# Altium schematic sheet Copy of LEDs.SchDoc
size A2; SheetNumber: 2; SheetTotal: 2
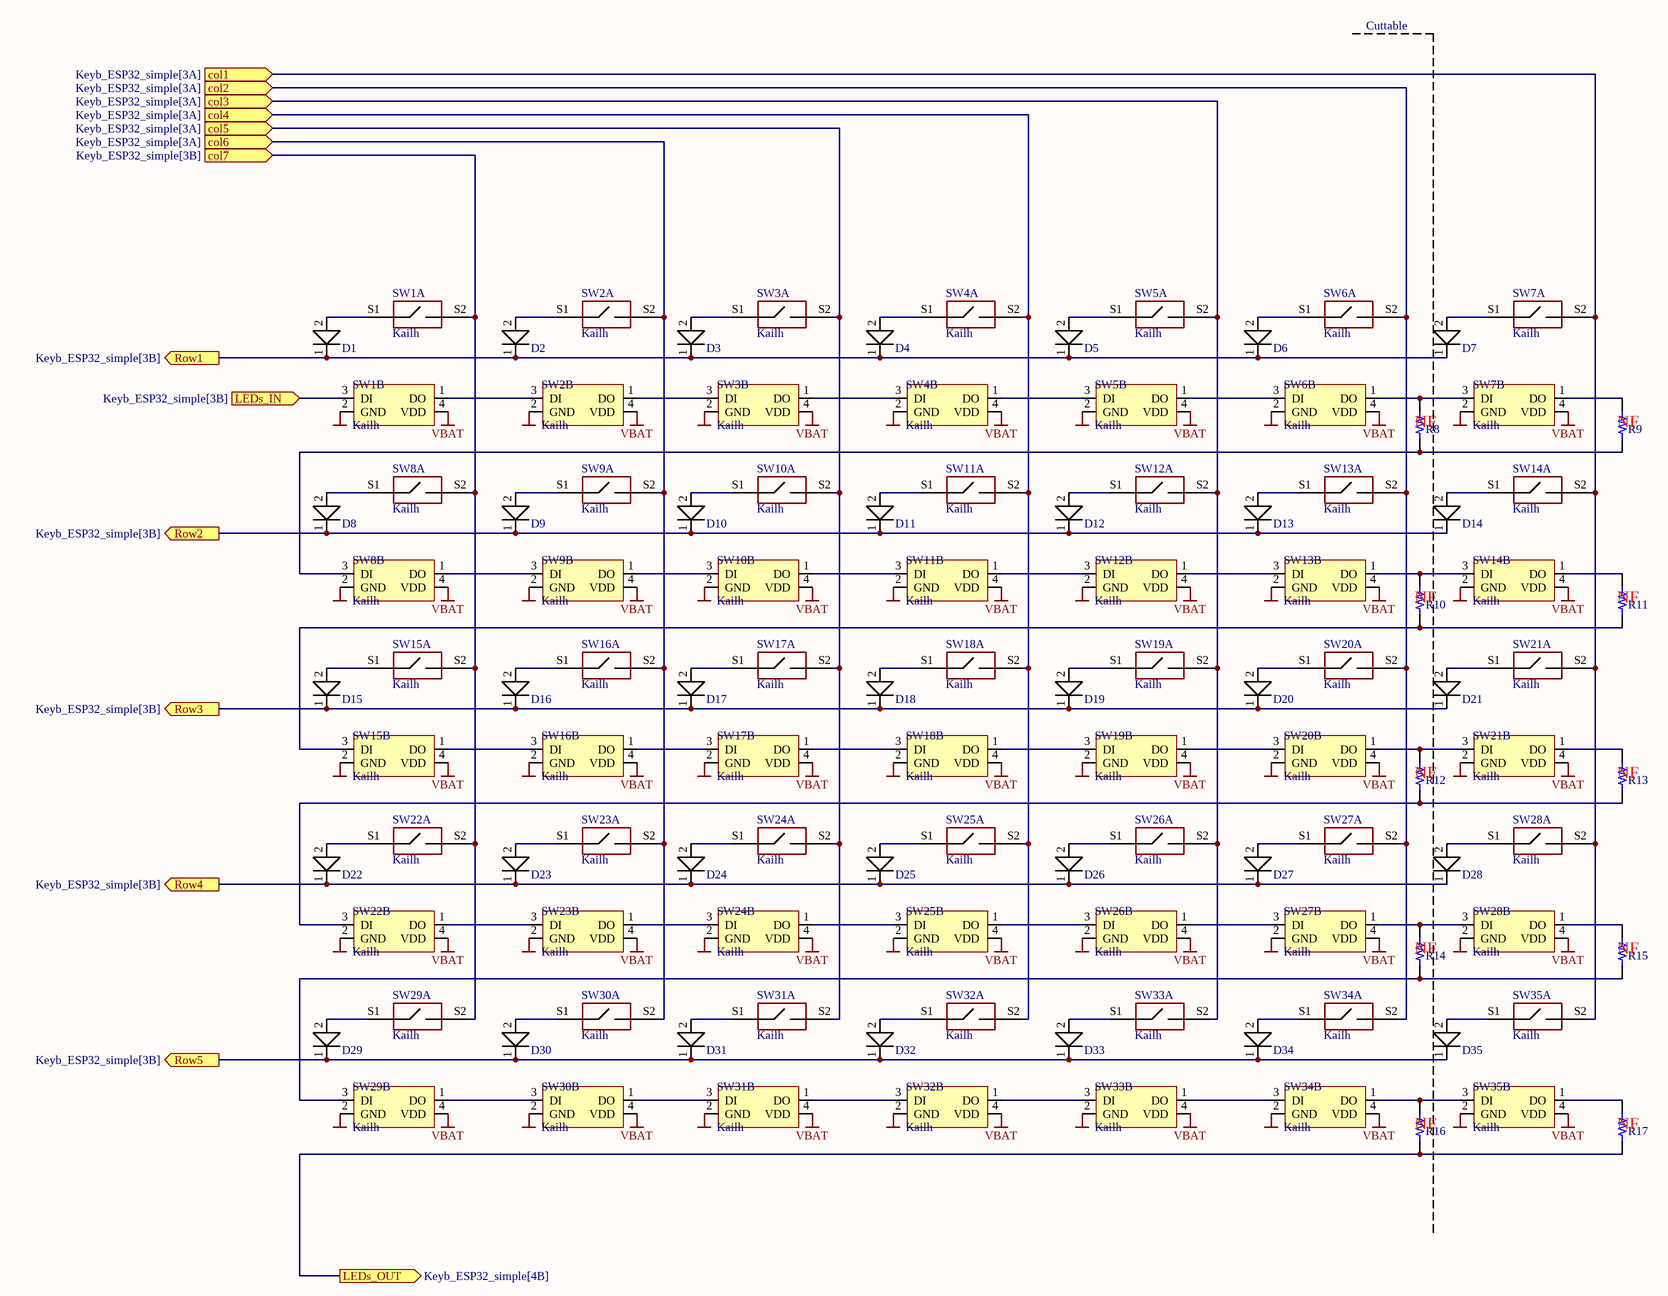
[diagram p0: Copy of LEDs.SchDoc]

## Parts
D1  1N4148  [SOD-123]  (value not drawn)
D2  1N4148  [SOD-123]  (value not drawn)
D3  1N4148  [SOD-123]  (value not drawn)
D4  1N4148  [SOD-123]  (value not drawn)
D5  1N4148  [SOD-123]  (value not drawn)
D6  1N4148  [SOD-123]  (value not drawn)
D7  1N4148  [SOD-123]  (value not drawn)
D8  1N4148  [SOD-123]  (value not drawn)
D9  1N4148  [SOD-123]  (value not drawn)
D10  1N4148  [SOD-123]  (value not drawn)
D11  1N4148  [SOD-123]  (value not drawn)
D12  1N4148  [SOD-123]  (value not drawn)
D13  1N4148  [SOD-123]  (value not drawn)
D14  1N4148  [SOD-123]  (value not drawn)
D15  1N4148  [SOD-123]  (value not drawn)
D16  1N4148  [SOD-123]  (value not drawn)
D17  1N4148  [SOD-123]  (value not drawn)
D18  1N4148  [SOD-123]  (value not drawn)
D19  1N4148  [SOD-123]  (value not drawn)
D20  1N4148  [SOD-123]  (value not drawn)
D21  1N4148  [SOD-123]  (value not drawn)
D22  1N4148  [SOD-123]  (value not drawn)
D23  1N4148  [SOD-123]  (value not drawn)
D24  1N4148  [SOD-123]  (value not drawn)
D25  1N4148  [SOD-123]  (value not drawn)
D26  1N4148  [SOD-123]  (value not drawn)
D27  1N4148  [SOD-123]  (value not drawn)
D28  1N4148  [SOD-123]  (value not drawn)
D29  1N4148  [SOD-123]  (value not drawn)
D30  1N4148  [SOD-123]  (value not drawn)
D31  1N4148  [SOD-123]  (value not drawn)
D32  1N4148  [SOD-123]  (value not drawn)
D33  1N4148  [SOD-123]  (value not drawn)
D34  1N4148  [SOD-123]  (value not drawn)
D35  1N4148  [SOD-123]  (value not drawn)
R8  (no value)  [RES 0603_1608]
R9  (no value)  [RES 0603_1608]
R10  (no value)  [RES 0603_1608]
R11  (no value)  [RES 0603_1608]
R12  (no value)  [RES 0603_1608]
R13  (no value)  [RES 0603_1608]
R14  (no value)  [RES 0603_1608]
R15  (no value)  [RES 0603_1608]
R16  (no value)  [RES 0603_1608]
R17  (no value)  [RES 0603_1608]
SW1  Kailh  [KAILH_MX_SOCKET_WS2812]  (parts A,B of 2)
SW2  Kailh  [KAILH_MX_SOCKET_WS2812]  (parts A,B of 2)
SW3  Kailh  [KAILH_MX_SOCKET_WS2812]  (parts A,B of 2)
SW4  Kailh  [KAILH_MX_SOCKET_WS2812]  (parts A,B of 2)
SW5  Kailh  [KAILH_MX_SOCKET_WS2812]  (parts A,B of 2)
SW6  Kailh  [KAILH_MX_SOCKET_WS2812]  (parts A,B of 2)
SW7  Kailh  [KAILH_MX_SOCKET_WS2812]  (parts A,B of 2)
SW8  Kailh  [KAILH_MX_SOCKET_WS2812]  (parts A,B of 2)
SW9  Kailh  [KAILH_MX_SOCKET_WS2812]  (parts A,B of 2)
SW10  Kailh  [KAILH_MX_SOCKET_WS2812]  (parts A,B of 2)
SW11  Kailh  [KAILH_MX_SOCKET_WS2812]  (parts A,B of 2)
SW12  Kailh  [KAILH_MX_SOCKET_WS2812]  (parts A,B of 2)
SW13  Kailh  [KAILH_MX_SOCKET_WS2812]  (parts A,B of 2)
SW14  Kailh  [KAILH_MX_SOCKET_WS2812]  (parts A,B of 2)
SW15  Kailh  [KAILH_MX_SOCKET_WS2812]  (parts A,B of 2)
SW16  Kailh  [KAILH_MX_SOCKET_WS2812]  (parts A,B of 2)
SW17  Kailh  [KAILH_MX_SOCKET_WS2812]  (parts A,B of 2)
SW18  Kailh  [KAILH_MX_SOCKET_WS2812]  (parts A,B of 2)
SW19  Kailh  [KAILH_MX_SOCKET_WS2812]  (parts A,B of 2)
SW20  Kailh  [KAILH_MX_SOCKET_WS2812]  (parts A,B of 2)
SW21  Kailh  [KAILH_MX_SOCKET_WS2812]  (parts A,B of 2)
SW22  Kailh  [KAILH_MX_SOCKET_WS2812]  (parts A,B of 2)
SW23  Kailh  [KAILH_MX_SOCKET_WS2812]  (parts A,B of 2)
SW24  Kailh  [KAILH_MX_SOCKET_WS2812]  (parts A,B of 2)
SW25  Kailh  [KAILH_MX_SOCKET_WS2812]  (parts A,B of 2)
SW26  Kailh  [KAILH_MX_SOCKET_WS2812]  (parts A,B of 2)
SW27  Kailh  [KAILH_MX_SOCKET_WS2812]  (parts A,B of 2)
SW28  Kailh  [KAILH_MX_SOCKET_WS2812]  (parts A,B of 2)
SW29  Kailh  [KAILH_MX_SOCKET_WS2812]  (parts A,B of 2)
SW30  Kailh  [KAILH_MX_SOCKET_WS2812]  (parts A,B of 2)
SW31  Kailh  [KAILH_MX_SOCKET_WS2812]  (parts A,B of 2)
SW32  Kailh  [KAILH_MX_SOCKET_WS2812]  (parts A,B of 2)
SW33  Kailh  [KAILH_MX_SOCKET_WS2812]  (parts A,B of 2)
SW34  Kailh  [KAILH_MX_SOCKET_WS2812]  (parts A,B of 2)
SW35  Kailh  [KAILH_MX_SOCKET_WS2812]  (parts A,B of 2)

## Ports
col1 (in, see Keyb_ESP32_simple[3A]), col2 (in, see Keyb_ESP32_simple[3A]), col3 (in, see Keyb_ESP32_simple[3A]), col4 (in, see Keyb_ESP32_simple[3A]), col5 (in, see Keyb_ESP32_simple[3A]), col6 (in, see Keyb_ESP32_simple[3A]), col7 (in, see Keyb_ESP32_simple[3B]), LEDs_IN (in, see Keyb_ESP32_simple[3B]), LEDs_OUT (out, see Keyb_ESP32_simple[4B]), Row1 (out, see Keyb_ESP32_simple[3B]), Row2 (out, see Keyb_ESP32_simple[3B]), Row3 (out, see Keyb_ESP32_simple[3B]), Row4 (out, see Keyb_ESP32_simple[3B]), Row5 (out, see Keyb_ESP32_simple[3B])

## Nets
GND: SW1.2(GND) SW2.2(GND) SW3.2(GND) SW4.2(GND) SW5.2(GND) SW6.2(GND) SW7.2(GND) SW8.2(GND) SW9.2(GND) SW10.2(GND) SW11.2(GND) SW12.2(GND) SW13.2(GND) SW14.2(GND) SW15.2(GND) SW16.2(GND) SW17.2(GND) SW18.2(GND) SW19.2(GND) SW20.2(GND) SW21.2(GND) SW22.2(GND) SW23.2(GND) SW24.2(GND) SW25.2(GND) SW26.2(GND) SW27.2(GND) SW28.2(GND) SW29.2(GND) SW30.2(GND) SW31.2(GND) SW32.2(GND) SW33.2(GND) SW34.2(GND) SW35.2(GND)
VBAT: SW1.4(VDD) SW2.4(VDD) SW3.4(VDD) SW4.4(VDD) SW5.4(VDD) SW6.4(VDD) SW7.4(VDD) SW8.4(VDD) SW9.4(VDD) SW10.4(VDD) SW11.4(VDD) SW12.4(VDD) SW13.4(VDD) SW14.4(VDD) SW15.4(VDD) SW16.4(VDD) SW17.4(VDD) SW18.4(VDD) SW19.4(VDD) SW20.4(VDD) SW21.4(VDD) SW22.4(VDD) SW23.4(VDD) SW24.4(VDD) SW25.4(VDD) SW26.4(VDD) SW27.4(VDD) SW28.4(VDD) SW29.4(VDD) SW30.4(VDD) SW31.4(VDD) SW32.4(VDD) SW33.4(VDD) SW34.4(VDD) SW35.4(VDD)
col1: SW7.S2 SW14.S2 SW21.S2 SW28.S2 SW35.S2 ; port col1
col2: SW6.S2 SW13.S2 SW20.S2 SW27.S2 SW34.S2 ; port col2
col3: SW5.S2 SW12.S2 SW19.S2 SW26.S2 SW33.S2 ; port col3
col4: SW4.S2 SW11.S2 SW18.S2 SW25.S2 SW32.S2 ; port col4
col5: SW3.S2 SW10.S2 SW17.S2 SW24.S2 SW31.S2 ; port col5
col6: SW2.S2 SW9.S2 SW16.S2 SW23.S2 SW30.S2 ; port col6
col7: SW1.S2 SW8.S2 SW15.S2 SW22.S2 SW29.S2 ; port col7
LEDs_IN: SW1.3(DI) ; port LEDs_IN
LEDs_OUT: R16.2 R17.2 ; port LEDs_OUT
Row1: D1.1(S8) D2.1(S8) D3.1(S8) D4.1(S8) D5.1(S8) D6.1(S8) D7.1(S8) ; port Row1
Row2: D8.1(S8) D9.1(S8) D10.1(S8) D11.1(S8) D12.1(S8) D13.1(S8) D14.1(S8) ; port Row2
Row3: D15.1(S8) D16.1(S8) D17.1(S8) D18.1(S8) D19.1(S8) D20.1(S8) D21.1(S8) ; port Row3
Row4: D22.1(S8) D23.1(S8) D24.1(S8) D25.1(S8) D26.1(S8) D27.1(S8) D28.1(S8) ; port Row4
Row5: D29.1(S8) D30.1(S8) D31.1(S8) D32.1(S8) D33.1(S8) D34.1(S8) D35.1(S8) ; port Row5
NetD1_2: D1.2(S7) SW1.S1
NetD2_2: D2.2(S7) SW2.S1
NetD3_2: D3.2(S7) SW3.S1
NetD4_2: D4.2(S7) SW4.S1
NetD5_2: D5.2(S7) SW5.S1
NetD6_2: D6.2(S7) SW6.S1
NetD7_2: D7.2(S7) SW7.S1
NetD8_2: D8.2(S7) SW8.S1
NetD9_2: D9.2(S7) SW9.S1
NetD10_2: D10.2(S7) SW10.S1
NetD11_2: D11.2(S7) SW11.S1
NetD12_2: D12.2(S7) SW12.S1
NetD13_2: D13.2(S7) SW13.S1
NetD14_2: D14.2(S7) SW14.S1
NetD15_2: D15.2(S7) SW15.S1
NetD16_2: D16.2(S7) SW16.S1
NetD17_2: D17.2(S7) SW17.S1
NetD18_2: D18.2(S7) SW18.S1
NetD19_2: D19.2(S7) SW19.S1
NetD20_2: D20.2(S7) SW20.S1
NetD21_2: D21.2(S7) SW21.S1
NetD22_2: D22.2(S7) SW22.S1
NetD23_2: D23.2(S7) SW23.S1
NetD24_2: D24.2(S7) SW24.S1
NetD25_2: D25.2(S7) SW25.S1
NetD26_2: D26.2(S7) SW26.S1
NetD27_2: D27.2(S7) SW27.S1
NetD28_2: D28.2(S7) SW28.S1
NetD29_2: D29.2(S7) SW29.S1
NetD30_2: D30.2(S7) SW30.S1
NetD31_2: D31.2(S7) SW31.S1
NetD32_2: D32.2(S7) SW32.S1
NetD33_2: D33.2(S7) SW33.S1
NetD34_2: D34.2(S7) SW34.S1
NetD35_2: D35.2(S7) SW35.S1
NetR8_1: R8.1 SW6.1(DO) SW7.3(DI)
NetR8_2: R8.2 R9.2 SW8.3(DI)
NetR9_1: R9.1 SW7.1(DO)
NetR10_1: R10.1 SW13.1(DO) SW14.3(DI)
NetR10_2: R10.2 R11.2 SW15.3(DI)
NetR11_1: R11.1 SW14.1(DO)
NetR12_1: R12.1 SW20.1(DO) SW21.3(DI)
NetR12_2: R12.2 R13.2 SW22.3(DI)
NetR13_1: R13.1 SW21.1(DO)
NetR14_1: R14.1 SW27.1(DO) SW28.3(DI)
NetR14_2: R14.2 R15.2 SW29.3(DI)
NetR15_1: R15.1 SW28.1(DO)
NetR16_1: R16.1 SW34.1(DO) SW35.3(DI)
NetR17_1: R17.1 SW35.1(DO)
NetSW1_1: SW1.1(DO) SW2.3(DI)
NetSW2_1: SW2.1(DO) SW3.3(DI)
NetSW3_1: SW3.1(DO) SW4.3(DI)
NetSW4_1: SW4.1(DO) SW5.3(DI)
NetSW5_1: SW5.1(DO) SW6.3(DI)
NetSW8_1: SW8.1(DO) SW9.3(DI)
NetSW9_1: SW9.1(DO) SW10.3(DI)
NetSW10_1: SW10.1(DO) SW11.3(DI)
NetSW11_1: SW11.1(DO) SW12.3(DI)
NetSW12_1: SW12.1(DO) SW13.3(DI)
NetSW15_1: SW15.1(DO) SW16.3(DI)
NetSW16_1: SW16.1(DO) SW17.3(DI)
NetSW17_1: SW17.1(DO) SW18.3(DI)
NetSW18_1: SW18.1(DO) SW19.3(DI)
NetSW19_1: SW19.1(DO) SW20.3(DI)
NetSW22_1: SW22.1(DO) SW23.3(DI)
NetSW23_1: SW23.1(DO) SW24.3(DI)
NetSW24_1: SW24.1(DO) SW25.3(DI)
NetSW25_1: SW25.1(DO) SW26.3(DI)
NetSW26_1: SW26.1(DO) SW27.3(DI)
NetSW29_1: SW29.1(DO) SW30.3(DI)
NetSW30_1: SW30.1(DO) SW31.3(DI)
NetSW31_1: SW31.1(DO) SW32.3(DI)
NetSW32_1: SW32.1(DO) SW33.3(DI)
NetSW33_1: SW33.1(DO) SW34.3(DI)

## Notes on the sheet
- Cuttable
- (near R8) NF
- (near R9) NF
- (near R10) NF
- (near R11) NF
- (near R12) NF
- (near R13) NF
- (near R14) NF
- (near R15) NF
- (near R16) NF
- (near R17) NF

## Library data of the parts
R8-R17 = RCA06030000ZSEA: RES SMD 0 OHM JUMPER 1/10W 0603; Manufacturer: Vishay Dale; Power (Watts): 0.1W, 1/10W; Part Number: RCA06030000ZSEA; ComponentLink1Description: Datasheet; ComponentLink1URL: http://www.vishay.com/docs/20037/rcae3.pdf; ComponentLink2Description: DigiKey Link; ComponentLink2URL: http://digikey.com/product-detail/en/vishay-dale/RCA06030000ZSEA/541-2192-1-ND/4946845; Composition: Thick Film; Device Package: 0603 (1608 Metric); Features: Anti-Sulfur, Automotive AEC-Q200; Height - Seated (Max): 0.020" (0.50mm); LastUpdated: 9/2/2020 1:10:23 AM; Lifecycle Status: Active; Minimum Order: 1; Number of Terminations: 2; Operating Temperature: -55°C ~ 155°C; Package / Case: 0603 (1608 Metric); Packaging: TapeAndReel; PartId: 5740; Part Status: Active; Price: 0.01; Ratings: AEC-Q200; Series: RCA; Size / Dimension: 0.061" L x 0.033" W (1.55mm x 0.85mm); Supplier 1: DigiKey; Supplier Part Number 1: 541-2192-1-ND; Supplier Device Package: 0603; Tolerance: Jumper
SW1-SW35 = Kailh_hotswap_RGB_WS2812: Kailh keyboard switch, hotswap rgb ws2812 in 2020 package, dual-side hotswap options + low prifile variant